# EasyEDA Pro project BAD_USB_ESP32-S3.epro

# Schematic Schematic1
Board Name: Board1; Create Date: 2026-11-03; Page Name: P1; Project Name: my_progect; Schematic Name: Schematic1; Update Date: 2026-11-03; Company: EasyEDA.com; Page Size: A4; Version: V1.0
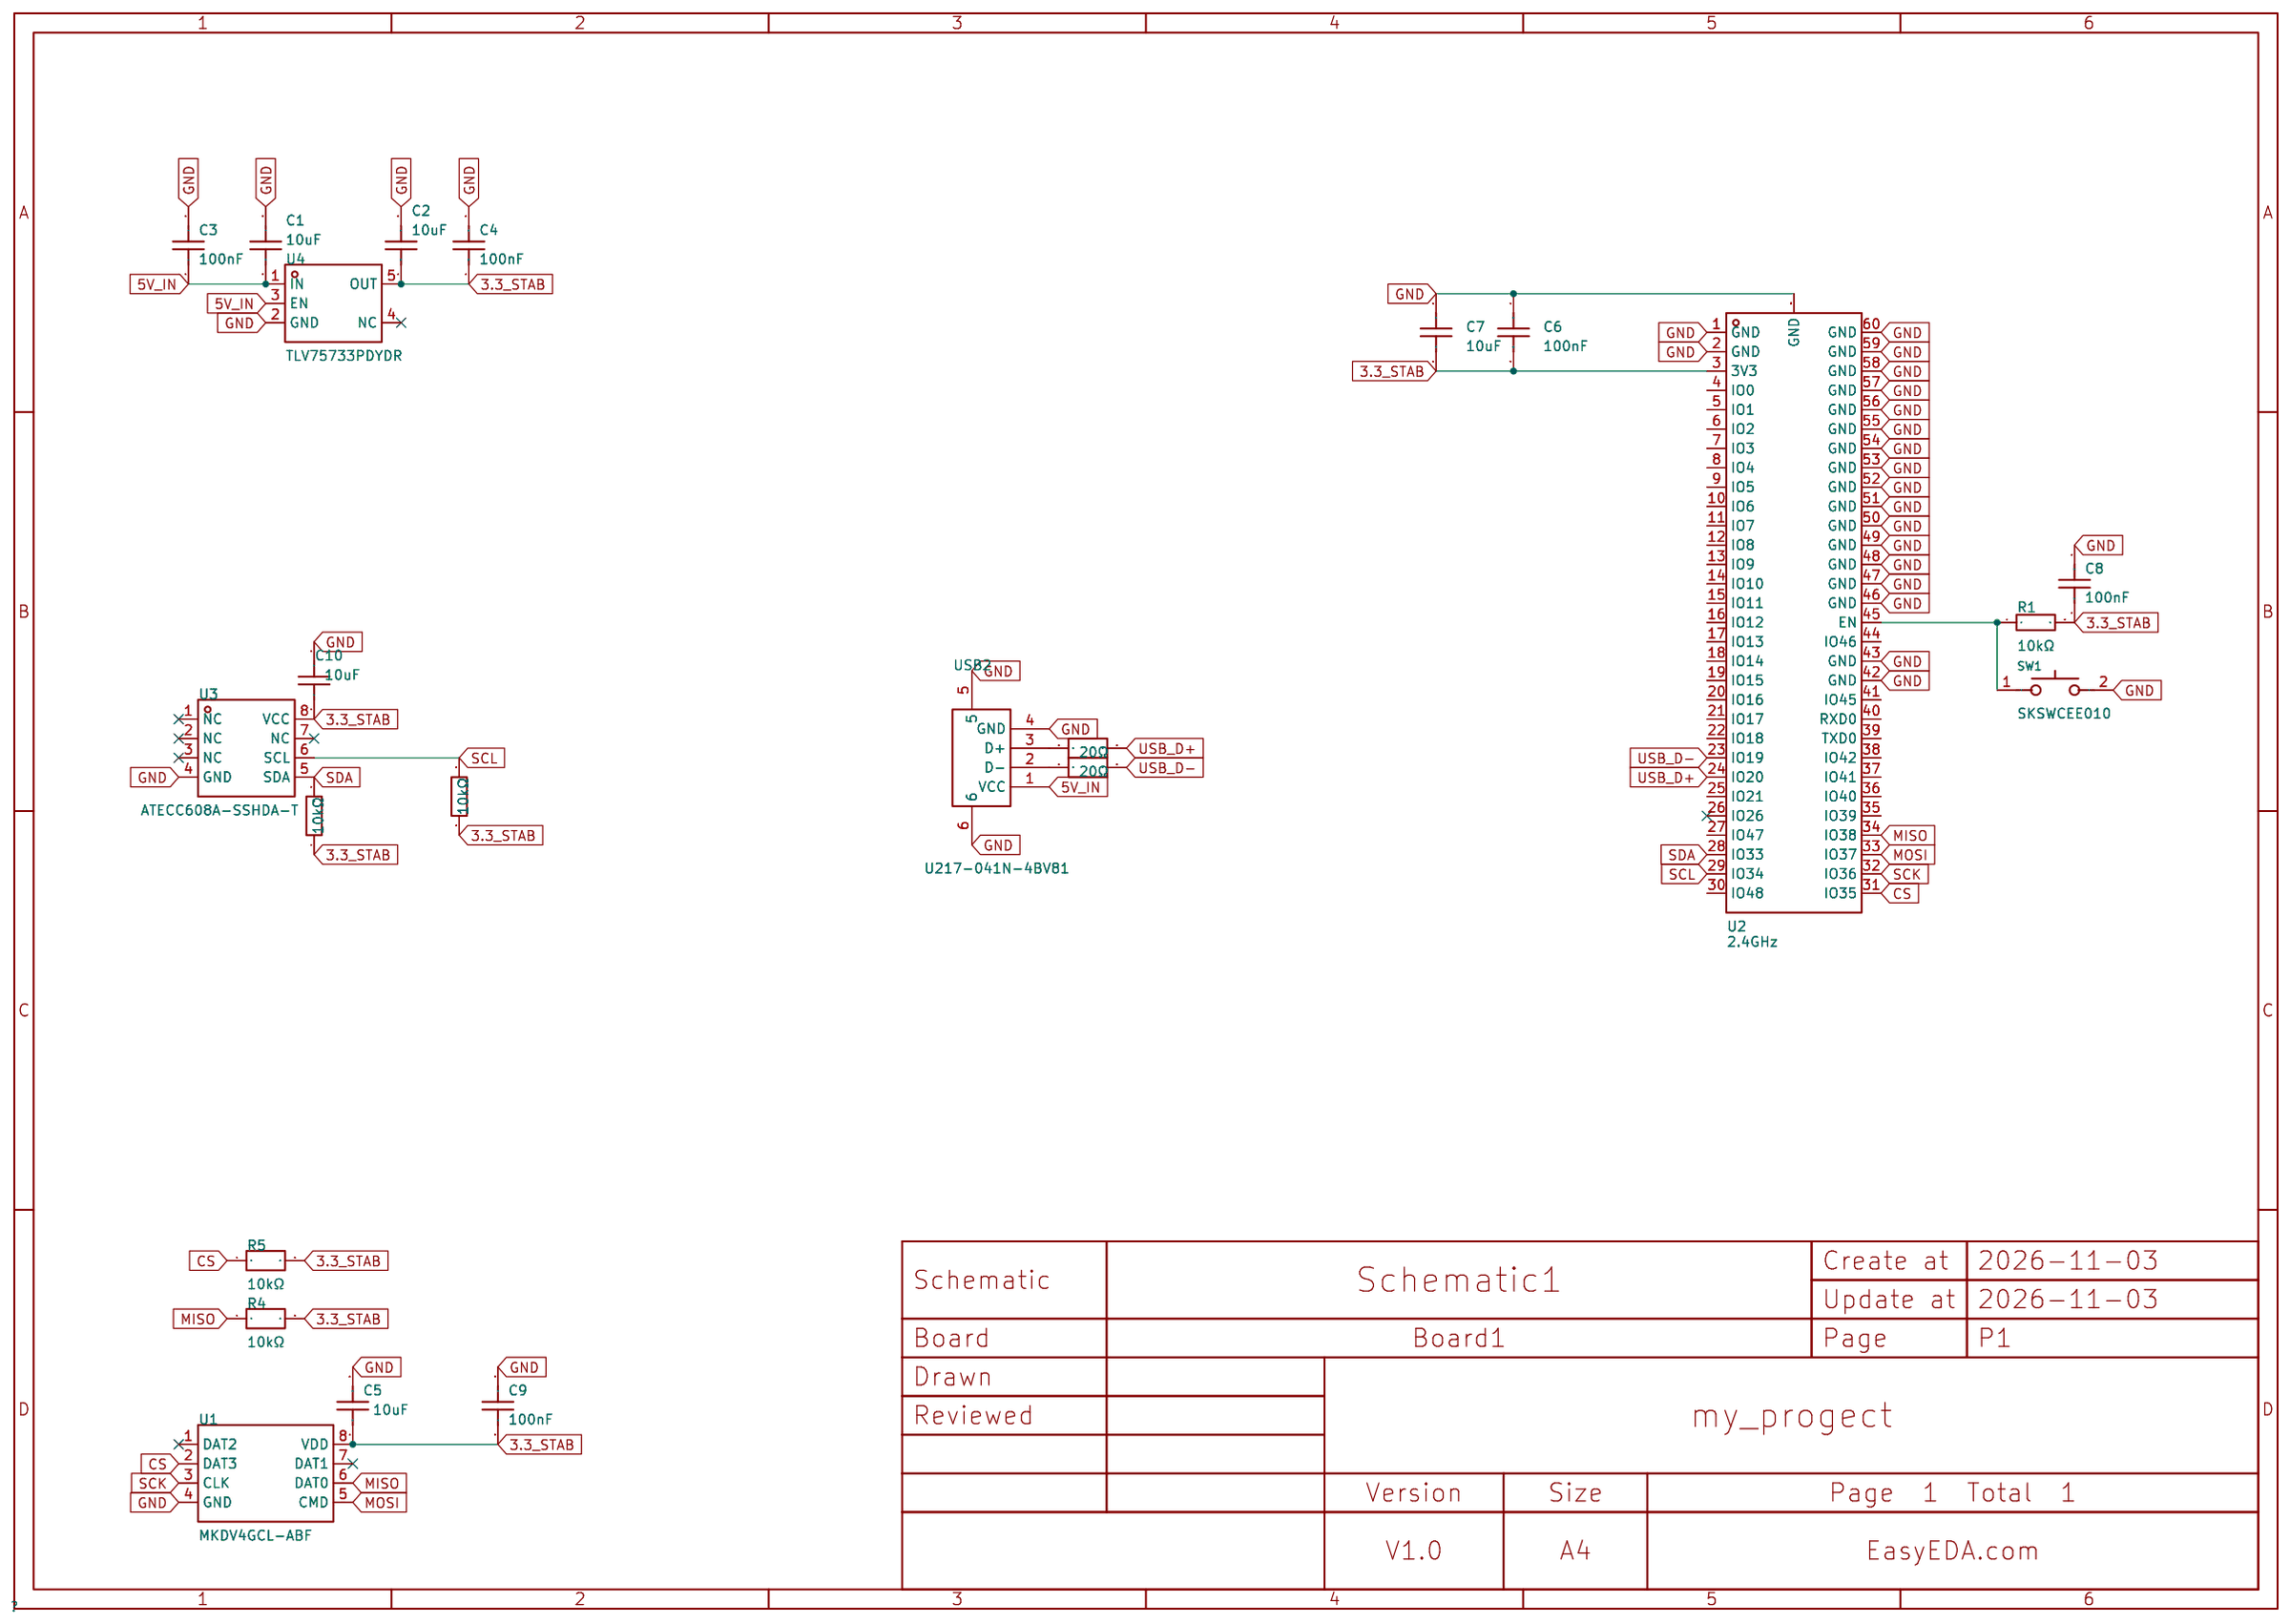
[diagram p0: schematic sheet]

## Parts
C1  10uF  [C0805]
C2  10uF  [C0805]
C3  100nF  [C0805]
C4  100nF  [C0805]
C5  10uF  [C0805]
C6  100nF  [C0805]
C7  10uF  [C0805]
C8  100nF  [C0805]
C9  100nF  [C0805]
C10  10uF  [C0805]
R1  10kΩ  [R0805]
R2  20Ω  [R0603]
R3  20Ω  [R0603]
R4  10kΩ  [R0603]
R5  10kΩ  [R0603]
R6  10kΩ  [R0805]
R7  10kΩ  [R0805]
SW1  SKSWCEE010  [SW-SMD_L3.0-W2.0-LS3.5]
U1  MKDV4GCL-ABF  [LGA-8_L8.0-W6.0-P1.27-TL_MKDV4GCL-ABF]
U2  2.4GHz  [BULETM-SMD_ESP32-S3-MINI-1-N8]
U3  ATECC608A-SSHDA-T  [SOIC-8_L4.9-W3.9-P1.27-LS6.0-BL]
U4  TLV75733PDYDR  [SOT-23-5_L2.9-W1.6-P0.95-LS2.8-BL-EP]
USB2  U217-041N-4BV81  [USB-A-SMD_U217-041N-4BV81]

## Library data of the parts
C1 C2 C5 C7 C10 = TCC0805X7R106K160FT: Capacitance:10uF Tolerance:±10% Tolerance:±10% Voltage Rating:16V Temperature Coefficient:X7R; LCSC Part Name: 10uF ±10% 16V; Supplier Part: C380347; Manufacturer: CCTC(三环); Supplier Footprint: 0805; JLCPCB Part Class: Extended Part; Datasheet: https://item.szlcsc.com/datasheet/TCC0805X7R106K160FT/352752.html; Supplier: LCSC; Tolerance: ±10%; Voltage Rating: 16V; Temperature Coefficient: X7R
C3 C4 C6 C8 C9 = CC0805KRX7R9BB104: Capacitance:100nF Tolerance:±10% Tolerance:±10% Voltage Rating:50V Temperature Coefficient:X7R; LCSC Part Name: 100nF ±10% 50V; Supplier Part: C49678; Manufacturer: YAGEO(国巨); Supplier Footprint: 0805; JLCPCB Part Class: Basic Part; Datasheet: https://item.szlcsc.com/datasheet/CC0805KRX7R9BB104/50686.html; Supplier: LCSC; Tolerance: ±10%; Voltage Rating: 50V; Temperature Coefficient: X7R
R1 R6 R7 = 0805W8F1002T5E: Type:Thick Film Resistor Resistance:10kΩ Tolerance:±1% Tolerance:±1% Power(Watts):125mW Voltage-Supply(Max):150V Temperature Coefficient:±100ppm/℃ Temperature Coefficient:±100ppm/℃ Operating Temperature:-55℃~+155℃ Operating Temperature:-55℃~+155℃; LCSC Part Name: 厚膜电阻 10kΩ ±1%; Supplier Part: C17414; Manufacturer: UNI-ROYAL(厚声); Supplier Footprint: 0805; JLCPCB Part Class: Basic Part; Datasheet: https://item.szlcsc.com/datasheet/0805W8F1002T5E/18102.html; Supplier: LCSC; Type: Thick Film Resistor; Tolerance: ±1%; Power(Watts): 125mW; Voltage-Supply(Max): 150V; Temperature Coefficient: ±100ppm/℃; Operating Temperature: -55℃~+155℃
R2 R3 = FRC0603F20R0TS: Type:Thick Film Resistor Resistance:20Ω Tolerance:±1% Tolerance:±1% Power(Watts):100mW Voltage-Supply(Max):75V Temperature Coefficient:±100ppm/℃ Temperature Coefficient:±100ppm/℃ Operating Temperature:-55℃~+155℃ Operating Temperature:-55℃~+155℃; LCSC Part Name: 20Ω ±1% 100mW 厚膜电阻; Supplier Part: C2907012; Manufacturer: FOJAN(富捷); Supplier Footprint: 0603; JLCPCB Part Class: Extended Part; Supplier: LCSC; Type: Thick Film Resistor; Tolerance: ±1%; Power(Watts): 100mW; Voltage-Supply(Max): 75V; Temperature Coefficient: ±100ppm/℃; Operating Temperature: -55℃~+155℃
R4 R5 = FRC0603F1002TS: Type:Thick Film Resistor Resistance:10kΩ Tolerance:±1% Tolerance:±1% Power(Watts):100mW Voltage-Supply(Max):75V Temperature Coefficient:±100ppm/℃ Temperature Coefficient:±100ppm/℃ Operating Temperature:-55℃~+155℃ Operating Temperature:-55℃~+155℃; LCSC Part Name: 10kΩ ±1% 100mW 厚膜电阻; Supplier Part: C2906982; Manufacturer: FOJAN(富捷); Supplier Footprint: 0603; JLCPCB Part Class: Extended Part; Datasheet: https://item.szlcsc.com/datasheet/FRC0603F1002TS/3180495.html; Supplier: LCSC; Type: Thick Film Resistor; Tolerance: ±1%; Power(Watts): 100mW; Voltage-Supply(Max): 75V; Temperature Coefficient: ±100ppm/℃; Operating Temperature: -55℃~+155℃
SW1 = SKSWCEE010: Circuit:SPST-NO Actuator Style:Round Button Operating Force:1.8N Mounting Type:Surface Mount,Vertical Length:3mm Width:2mm Switch Height:0.6mm Contact Current:50mA Voltage Rating:12V With Lamp:- IP Rating:IP67 Termination Style:SMD(SMT) Tab Life:300,000 c; LCSC Part Name: 3*2*0.6mm 立贴 轻触开关; Supplier Part: C202371; Manufacturer: ALPSALPINE(阿尔卑斯阿尔派); Supplier Footprint: SMD,3x2mm; JLCPCB Part Class: Extended Part; Datasheet: https://item.szlcsc.com/datasheet/SKSWCEE010/203571.html; Supplier: LCSC; Circuit: SPST-NO; Actuator Style: Round Button; Operating Force: 1.8N; Mounting Type: Surface Mount,Vertical; Length: 3mm; Width: 2mm; Switch Height: 0.6mm; Contact Current: 50mA; Voltage Rating: 12V; IP Rating: IP67; Termination Style: SMD(SMT) Tab; Life: 300,000 cycles; Operating Temperature: -30℃~+85℃
U1 = MKDV4GCL-ABF: Memory Size:4Gbit Interface:SD interface Clock Frequency:50MHz Voltage - Supply:2.7V~3.6V Voltage - Supply:2.7V~3.6V Write Cycle Time(tWC):- Page Program time (TPP):- Block Erase Time(tBE):- Data Retention - TDR (Year):10 years Operating Temperature:-25℃~; LCSC Part Name: 4Gb SD NAND 消费级 SLC SDNAND; Supplier Part: C51966232; Manufacturer: MK(米客方德); Supplier Footprint: LGA-8(6x8); JLCPCB Part Class: Extended Part; Datasheet: https://item.szlcsc.com/datasheet/MKDV4GCL-ABF/54699265.html; Supplier: LCSC; Memory Size: 4Gbit; Interface: SD interface; Clock Frequency: 50MHz; Voltage - Supply: 2.7V~3.6V; Data Retention - TDR (Year): 10 years; Operating Temperature: -25℃~+85℃; Standby Supply Current: 80uA; Program / Erase Cycles: 60,000 Cycles; Features: Bad block management；Wear leveling function；Supports SPI mode；Abnormal power-down protection
U2 = ESP32-S3-MINI-1-N8: Utilized IC / Part:ESP32-S3FN8 Chip Wireless Standard:Bluetooth5.0 Interface Type:SPI；I2S；USB；I2C；UART Frequency:2.4GHz Antenna Type:On-board PCB Antenna Output Power:20.5dBm Output Power:20.5dBm Voltage - Supply:3V~3.6V Voltage - Supply:3V~3.6V Receive; LCSC Part Name: 不带固件 小尺寸模组，集成2.4GHz Wi-Fi(802.11b/g/n)+Bluetooth 5(LE); Supplier Part: C2913206; Manufacturer: ESPRESSIF(乐鑫); Supplier Footprint: SMD; JLCPCB Part Class: Extended Part; Datasheet: https://item.szlcsc.com/datasheet/ESP32-S3-MINI-1-N8/3198304.html; Supplier: LCSC; Utilized IC / Part: ESP32-S3FN8 Chip; Wireless Standard: Bluetooth5.0; Interface Type: SPI；I2S；USB；I2C；UART; Antenna Type: On-board PCB Antenna; Output Power: 20.5dBm; Voltage - Supply: 3V~3.6V; Receive  Current: 97mA; Send  Current: 330mA; Sensitivity: -104.5dBm; Operating Temperature: -40℃~+85℃
U3 = ATECC608A-SSHDA-T_C616024: Interface:I2C Data Rate:1Mbps Operating Temperature:-40℃~+85℃ Operating Temperature:-40℃~+85℃ Features:Non-volatile configuration storage；Wake-up function; LCSC Part Name: 加密认证器件; Supplier Part: C616024; Manufacturer: MICROCHIP(美国微芯); Supplier Footprint: SOIC-8; JLCPCB Part Class: Extended Part; Datasheet: https://item.szlcsc.com/datasheet/ATECC608A-SSHDA-T/646002.html; Supplier: LCSC; Interface: I2C; Data Rate: 1Mbps; Operating Temperature: -40℃~+85℃; Features: Non-volatile configuration storage；Wake-up function
U4 = TLV75733PDYDR: Output Configuration:Positive Voltage - Supply:5.5V Output Voltage:3.3V Output Voltage:3.3V Output Current:1A Power Supply Rejection Ratio (PSRR):46dB@(100kHz) Voltage Dropout:425mV@(1A) standby current:25uA Noise:71.5uVrms Features:Built-in soft-start；En; LCSC Part Name: 3.3V 1A 5.5V; Supplier Part: C22399950; Manufacturer: TI(德州仪器); Supplier Footprint: SOT-23-5; JLCPCB Part Class: Extended Part; Datasheet: https://www.ti.com.cn/cn/lit/ds/symlink/tlv757p.pdf?ts=1731985234254&ref_url=https%253A%252F%252Fwww.ti.com.cn%252Fsitesearch%252Fzh-cn%252Fdocs%252Funiversalsearch.tsp%253FlangPref%253Dzh-CN%2526nr%253D9%2526searchTerm%253DTLV75733PDYDR; Supplier: LCSC; Output Configuration: Positive; Voltage - Supply: 5.5V; Output Voltage: 3.3V; Output Current: 1A; Power Supply Rejection Ratio (PSRR): 46dB@(100kHz); Voltage Dropout: 425mV@(1A); standby current: 25uA; Noise: 71.5uVrms; Features: Built-in soft-start；Enable control；Input under-voltage protection；Over Current Protection；Short Circuit Protection；Output discharge；Thermal shutdown; Operating Temperature: -40℃~+125℃; Output Type: Fixed; Number of Outputs: 1
USB2 = U217-041N-4BV81: Connector Type:Type-A Protocol Standard:- Gender:Male Mounting Type:Surface Mount, Right Angle Number of Contacts:4P Number of Ports:1 Current Rating-Power:1.5A Length:18.8mm Operating Temperature:-40℃~+85℃ Operating Temperature:-40℃~+85℃; LCSC Part Name: Type-A 公 卧贴; Supplier Part: C319178; Manufacturer: XKB Connection(中国星坤); Supplier Footprint: SMD; JLCPCB Part Class: Extended Part; Datasheet: https://item.szlcsc.com/datasheet/U217-041N-4BV81/300270.html; Supplier: LCSC; Connector Type: Type-A; Gender: Male; Mounting Type: Surface Mount, Right Angle; Number of Contacts: 4P; Number of Ports: 1; Current Rating-Power: 1.5A; Length: 18.8mm; Operating Temperature: -40℃~+85℃

## Nets
5V_IN: C1.1 C3.1 U4.1(IN) U4.3(EN) USB2.1(VCC)
GND: C1.2 C2.2 C3.2 C4.2 C5.2 C6.1 C7.1 C8.2 C9.2 C10.2 SW1.2 U1.4(GND) U2.1(GND) U2.2(GND) U2.42(GND) U2.43(GND) U2.46(GND) U2.47(GND) U2.48(GND) U2.49(GND) U2.50(GND) U2.51(GND) U2.52(GND) U2.53(GND) U2.54(GND) U2.55(GND) U2.56(GND) U2.57(GND) U2.58(GND) U2.59(GND) U2.60(GND) U2.GND U3.4(GND) U4.2(GND) USB2.4(GND) USB2.5 USB2.6
3.3_STAB: C2.1 C4.1 C5.1 C6.2 C7.2 C8.1 C9.1 C10.1 R1.2 R4.2 R5.2 R6.1 R7.1 U1.8(VDD) U2.3(3V3) U3.8(VCC) U4.5(OUT)
CS: R5.1 U1.2(DAT3) U2.31(IO35)
MISO: R4.1 U1.6(DAT0) U2.34(IO38)
MOSI: U1.5(CMD) U2.33(IO37)
SCK: U1.3(CLK) U2.32(IO36)
SCL: R6.2 U2.29(IO34) U3.6(SCL)
SDA: R7.2 U2.28(IO33) U3.5(SDA)
USB_D+: R3.2 U2.24(IO20)
USB_D-: R2.2 U2.23(IO19)
Net-(R1-1): R1.1 SW1.1 U2.45(EN)
Net-(R2-1): R2.1 USB2.2(D-)
Net-(R3-1): R3.1 USB2.3(D+)

Not connected (* = marked no-connect by the designer): U1 1(DAT2)* 7(DAT1)*; U2 4(IO0) 5(IO1) 6(IO2) 7(IO3) 8(IO4) 9(IO5) 10(IO6) 11(IO7) 12(IO8) 13(IO9) 14(IO10) 15(IO11) 16(IO12) 17(IO13) 18(IO14) 19(IO15) 20(IO16) 21(IO17) 22(IO18) 25(IO21) 26(IO26)* 27(IO47) 30(IO48) 35(IO39) 36(IO40) 37(IO41) 38(IO42) 39(TXD0) 40(RXD0) 41(IO45) 44(IO46); U3 1(NC)* 2(NC)* 3(NC)* 7(NC)*; U4 4(NC)*
